# Altium schematic sheet 01_POWER.SchDoc
size A3; SheetNumber: 1; SheetTotal: 7
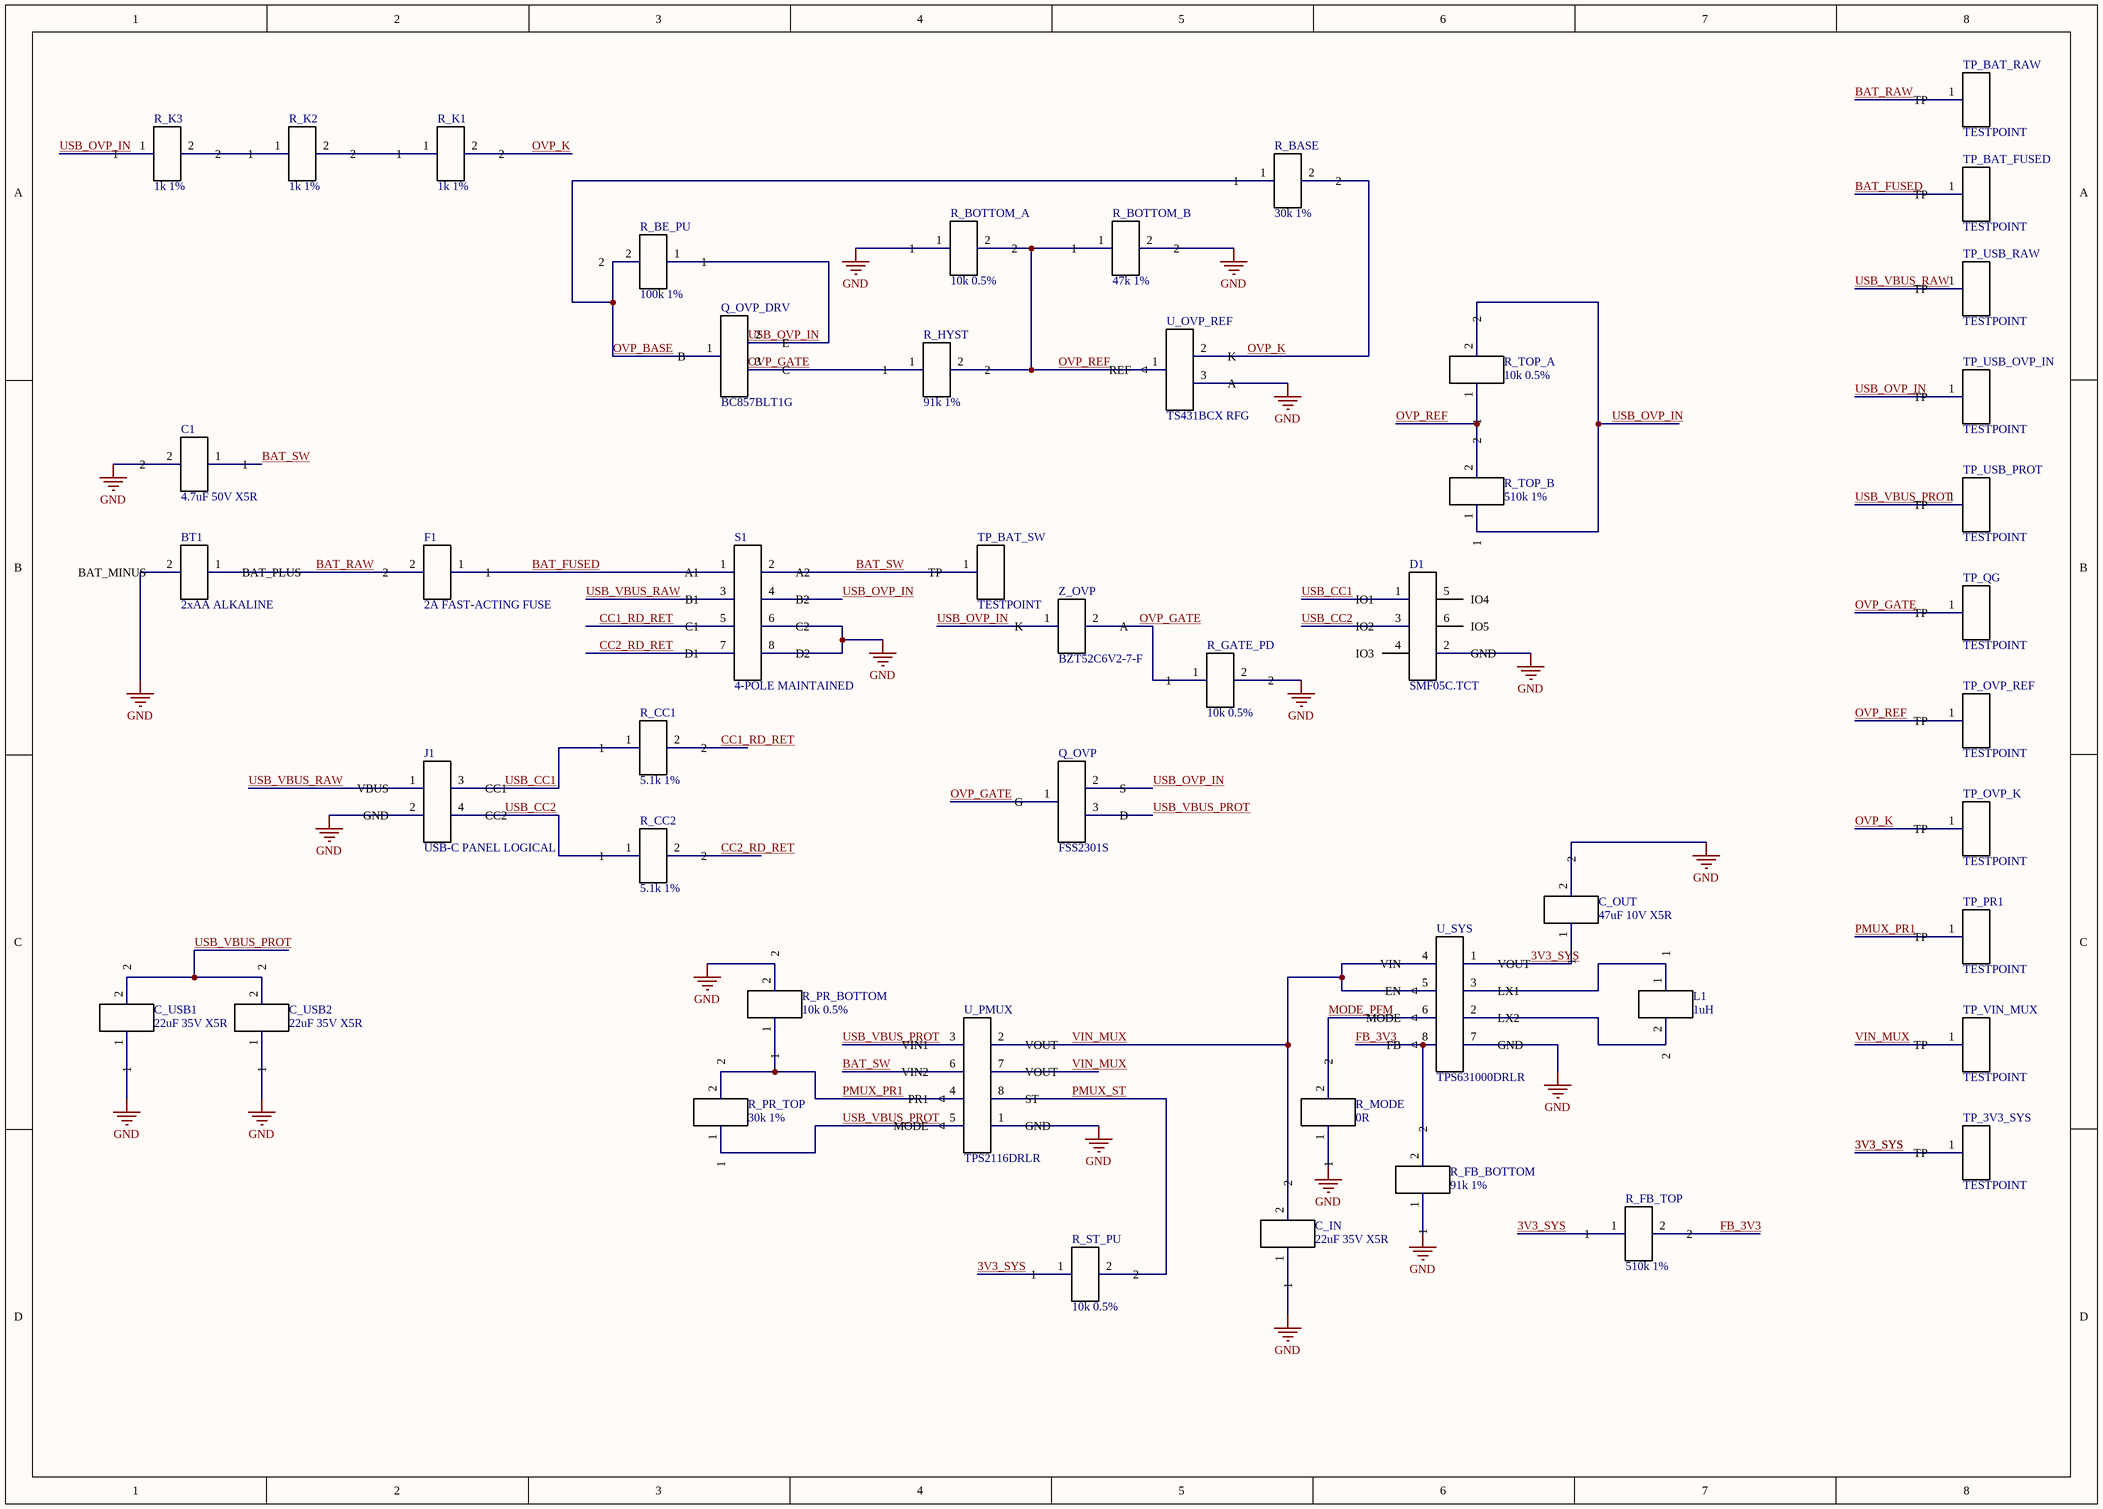
[diagram p0: 01_POWER.SchDoc]

## Parts
BT1  2xAA ALKALINE  [JST_XH_B2B_XH_A_2P_THT]
C1  4.7uF 50V X5R  [TDK_C2012_0805_CAP_2P]
C_IN  22uF 35V X5R  [TDK_C2012_0805_CAP_2P]
C_OUT  47uF 10V X5R  [TDK_C2012_0805_CAP_2P]
C_USB1  22uF 35V X5R  [TDK_C2012_0805_CAP_2P]
C_USB2  22uF 35V X5R  [TDK_C2012_0805_CAP_2P]
D1  SMF05C.TCT  [SEMTECH_SC70_6L_SMF05C]
F1  2A FAST-ACTING FUSE  [JDT_JFC2410FS_2P]
J1  USB-C PANEL LOGICAL  [JST_XH_B4B_XH_A_4P_THT]
L1  1uH  [MURATA_DFE322512F_2P]
Q_OVP  FSS2301S  [FOSAN_SOT23_FSS2301S_3P]
Q_OVP_DRV  BC857BLT1G  [ONSEMI_CASE318_SOT23_3P]
R_BASE  30k 1%  [RES_0603_SHARED_2P]
R_BE_PU  100k 1%  [RES_0603_SHARED_2P]
R_BOTTOM_A  10k 0.5%  [RES_0805_SHARED_2P]
R_BOTTOM_B  47k 1%  [RES_0603_SHARED_2P]
R_CC1  5.1k 1%  [RES_0603_SHARED_2P]
R_CC2  5.1k 1%  [RES_0603_SHARED_2P]
R_FB_BOTTOM  91k 1%  [RES_0805_SHARED_2P]
R_FB_TOP  510k 1%  [UNIROYAL_RES_1206_2P]
R_GATE_PD  10k 0.5%  [RES_0805_SHARED_2P]
R_HYST  91k 1%  [RES_0805_SHARED_2P]
R_K1  1k 1%  [RES_0805_SHARED_2P]
R_K2  1k 1%  [RES_0805_SHARED_2P]
R_K3  1k 1%  [RES_0805_SHARED_2P]
R_MODE  0R  [RES_0603_SHARED_2P]
R_PR_BOTTOM  10k 0.5%  [RES_0805_SHARED_2P]
R_PR_TOP  30k 1%  [RES_0603_SHARED_2P]
R_ST_PU  10k 0.5%  [RES_0805_SHARED_2P]
R_TOP_A  10k 0.5%  [RES_0805_SHARED_2P]
R_TOP_B  510k 1%  [UNIROYAL_RES_1206_2P]
S1  4-POLE MAINTAINED  [JST_XH_B8B_XH_A_8P_THT]
TP_3V3_SYS  TESTPOINT  [TESTPOINT_GENERIC_1P5MM]
TP_BAT_FUSED  TESTPOINT  [TESTPOINT_GENERIC_1P5MM]
TP_BAT_RAW  TESTPOINT  [TESTPOINT_GENERIC_1P5MM]
TP_BAT_SW  TESTPOINT  [TESTPOINT_GENERIC_1P5MM]
TP_OVP_K  TESTPOINT  [TESTPOINT_GENERIC_1P5MM]
TP_OVP_REF  TESTPOINT  [TESTPOINT_GENERIC_1P5MM]
TP_PR1  TESTPOINT  [TESTPOINT_GENERIC_1P5MM]
TP_QG  TESTPOINT  [TESTPOINT_GENERIC_1P5MM]
TP_USB_OVP_IN  TESTPOINT  [TESTPOINT_GENERIC_1P5MM]
TP_USB_PROT  TESTPOINT  [TESTPOINT_GENERIC_1P5MM]
TP_USB_RAW  TESTPOINT  [TESTPOINT_GENERIC_1P5MM]
TP_VIN_MUX  TESTPOINT  [TESTPOINT_GENERIC_1P5MM]
U_OVP_REF  TS431BCX RFG  [TSC_SOT23_TS431_3P]
U_PMUX  TPS2116DRLR  [TI_DRL0008A_8P]
U_SYS  TPS631000DRLR  [TI_DRL0008A_8P]
Z_OVP  BZT52C6V2-7-F  [DIODES_SOD123_2P]

## Nets
GND: BT1.2(BAT_MINUS) C1.2 C_IN.1 C_OUT.2 C_USB1.1 C_USB2.1 D1.2(GND) J1.2(GND) R_BOTTOM_A.1 R_BOTTOM_B.2 R_FB_BOTTOM.1 R_GATE_PD.2 R_MODE.1 R_PR_BOTTOM.2 S1.6(C2) S1.8(D2) U_OVP_REF.3(A) U_PMUX.1(GND) U_SYS.7(GND)
3V3_SYS: C_OUT.1 R_FB_TOP.1 R_ST_PU.1 TP_3V3_SYS.1(TP) U_SYS.1(VOUT)
BAT_FUSED: F1.1 S1.1(A1) TP_BAT_FUSED.1(TP)
BAT_RAW: BT1.1(BAT_PLUS) F1.2 TP_BAT_RAW.1(TP)
BAT_SW: C1.1 S1.2(A2) TP_BAT_SW.1(TP) U_PMUX.6(VIN2)
CC1_RD_RET: R_CC1.2 S1.5(C1)
CC2_RD_RET: R_CC2.2 S1.7(D1)
FB_3V3: R_FB_BOTTOM.2 R_FB_TOP.2 U_SYS.8(FB)
MODE_PFM: R_MODE.2 U_SYS.6(MODE)
OVP_BASE: Q_OVP_DRV.1(B) R_BASE.1 R_BE_PU.2
OVP_GATE: Q_OVP.1(G) Q_OVP_DRV.3(C) R_GATE_PD.1 R_HYST.1 TP_QG.1(TP) Z_OVP.2(A)
OVP_K: R_BASE.2 R_K1.2 TP_OVP_K.1(TP) U_OVP_REF.2(K)
OVP_REF: R_BOTTOM_A.2 R_BOTTOM_B.1 R_HYST.2 R_TOP_A.1 R_TOP_B.2 TP_OVP_REF.1(TP) U_OVP_REF.1(REF)
PMUX_PR1: R_PR_BOTTOM.1 R_PR_TOP.2 TP_PR1.1(TP) U_PMUX.4(PR1)
PMUX_ST: R_ST_PU.2 U_PMUX.8(ST)
USB_CC1: D1.1(IO1) J1.3(CC1) R_CC1.1
USB_CC2: D1.3(IO2) J1.4(CC2) R_CC2.1
USB_OVP_IN: Q_OVP.2(S) Q_OVP_DRV.2(E) R_BE_PU.1 R_K3.1 R_TOP_A.2 R_TOP_B.1 S1.4(B2) TP_USB_OVP_IN.1(TP) Z_OVP.1(K)
USB_VBUS_PROT: C_USB1.2 C_USB2.2 Q_OVP.3(D) R_PR_TOP.1 TP_USB_PROT.1(TP) U_PMUX.3(VIN1) U_PMUX.5(MODE)
USB_VBUS_RAW: J1.1(VBUS) S1.3(B1) TP_USB_RAW.1(TP)
VIN_MUX: C_IN.2 TP_VIN_MUX.1(TP) U_PMUX.2(VOUT) U_PMUX.7(VOUT) U_SYS.4(VIN) U_SYS.5(EN)
NetL1_1: L1.1 U_SYS.3(LX1)
NetL1_2: L1.2 U_SYS.2(LX2)
NetR_K1_1: R_K1.1 R_K2.2
NetR_K2_1: R_K2.1 R_K3.2

Not connected (* = marked no-connect by the designer): D1 4(IO3) 5(IO4) 6(IO5)

## Library data of the parts
BT1 = BATTERY_2XAA_OFFBOARD: Off-board two-cell AA battery holder logical interface; Manufacturer: PROJECT_LOGICAL; Source_Baseline: POWER_SCHEMATIC_ENTRY_BASELINE_v0.17_FA.txt; Qualification_Status: UNQUALIFIED_PENDING_SAVE_REOPEN_AUDIT; PIN_NUMBER_SOURCE: PROJECT_LOGICAL_DEFINITION; MPN: BATTERY_2XAA_OFFBOARD; Value: 2xAA ALKALINE; Package: LOGICAL_OFFBOARD; Datasheet: POWER_SCHEMATIC_ENTRY_BASELINE_v0.17_FA.txt; Design_Status: PROJECT_LOGICAL; PIN_FUNCTION_SOURCE: PROJECT_LOGICAL_DEFINITION
C1 = C2012X5R1H475K125AB: Battery-side local ceramic capacitor; Manufacturer: TDK; Source_Baseline: POWER_SCHEMATIC_ENTRY_BASELINE_v0.17_FA.txt; Design_Status: CONTROLLED_V0.17_P9; Qualification_Status: UNQUALIFIED_PENDING_SAVE_REOPEN_AUDIT; PIN_NUMBER_SOURCE: INTERNAL_CONVENTION; PIN_FUNCTION_SOURCE: MANUFACTURER_DATASHEET; MPN: C2012X5R1H475K125AB; Value: 4.7uF 50V X5R; Package: 0805 / 2012 metric; Datasheet: TDK exact product data C2012X5R1H475K125AB
C_IN C_USB1 C_USB2 = C2012X5R1V226M125AC: Power-path ceramic capacitor; Manufacturer: TDK; Source_Baseline: POWER_SCHEMATIC_ENTRY_BASELINE_v0.17_FA.txt; Design_Status: CONTROLLED_V0.17_P9; Qualification_Status: UNQUALIFIED_PENDING_SAVE_REOPEN_AUDIT; PIN_NUMBER_SOURCE: INTERNAL_CONVENTION; PIN_FUNCTION_SOURCE: MANUFACTURER_DATASHEET; MPN: C2012X5R1V226M125AC; Value: 22uF 35V X5R; Package: 0805 / 2012 metric; Datasheet: TDK exact product data C2012X5R1V226M125AC
C_OUT = C2012X5R1A476M125AC: 3V3 output ceramic capacitor; Manufacturer: TDK; Source_Baseline: POWER_SCHEMATIC_ENTRY_BASELINE_v0.17_FA.txt; Design_Status: CONTROLLED_V0.17_P9; Qualification_Status: UNQUALIFIED_PENDING_SAVE_REOPEN_AUDIT; PIN_NUMBER_SOURCE: INTERNAL_CONVENTION; PIN_FUNCTION_SOURCE: MANUFACTURER_DATASHEET; MPN: C2012X5R1A476M125AC; Value: 47uF 10V X5R; Package: 0805 / 2012 metric; Datasheet: TDK exact product data C2012X5R1A476M125AC
D1 = SMF05C.TCT: Five-line ESD protection array; Manufacturer: Semtech; Source_Baseline: POWER_SCHEMATIC_ENTRY_BASELINE_v0.17_FA.txt; Design_Status: CONTROLLED_V0.17; Qualification_Status: UNQUALIFIED_PENDING_SAVE_REOPEN_AUDIT; PIN_NUMBER_SOURCE: MANUFACTURER_DATASHEET; MPN: SMF05C.TCT; Value: SMF05C.TCT; Package: SC70-6; Datasheet: https://www.semtech.com/products/circuit-protection/esd-protection/smf05c; PIN_FUNCTION_SOURCE: MANUFACTURER_DATASHEET
F1 = JFC2410-1200FS: Battery input fast-acting fuse; Manufacturer: JDT Fuse; Source_Baseline: POWER_SCHEMATIC_ENTRY_BASELINE_v0.17_FA.txt; Design_Status: PROCUREMENT_LOCK_P9_PENDING; Qualification_Status: UNQUALIFIED_PENDING_SAVE_REOPEN_AUDIT; PIN_NUMBER_SOURCE: INTERNAL_CONVENTION; PIN_FUNCTION_SOURCE: MANUFACTURER_DATASHEET; MPN: JFC2410-1200FS; Value: 2A FAST-ACTING FUSE; Package: 2410 SMD; Datasheet: https://www.jdtfuse.com/upload/PDF/JFC2410FS.pdf
J1 = USB_C_PANEL_LOGICAL: Off-board USB-C panel connector logical interface; Manufacturer: PROJECT_LOGICAL; Source_Baseline: POWER_SCHEMATIC_ENTRY_BASELINE_v0.17_FA.txt; Qualification_Status: UNQUALIFIED_PENDING_SAVE_REOPEN_AUDIT; PIN_NUMBER_SOURCE: PROJECT_LOGICAL_DEFINITION; MPN: USB_C_PANEL_LOGICAL; Value: USB-C PANEL LOGICAL; Package: LOGICAL_OFFBOARD; Datasheet: POWER_SCHEMATIC_ENTRY_BASELINE_v0.17_FA.txt; Design_Status: PROJECT_LOGICAL; PIN_FUNCTION_SOURCE: PROJECT_LOGICAL_DEFINITION
L1 = DFE322512F-1R0M=P2: Shielded power inductor; Manufacturer: Murata; Source_Baseline: POWER_SCHEMATIC_ENTRY_BASELINE_v0.17_FA.txt; Design_Status: DESIGN_LOCK_V0.17_P9_PENDING; Qualification_Status: UNQUALIFIED_PENDING_SAVE_REOPEN_AUDIT; PIN_NUMBER_SOURCE: INTERNAL_CONVENTION; PIN_FUNCTION_SOURCE: MANUFACTURER_DATASHEET; MPN: DFE322512F-1R0M=P2; Value: 1uH; Package: DFE3225; Datasheet: Murata DFE322512F product data
Q_OVP = FSS2301S: -20V P-channel enhancement MOSFET used as USB OVP switch; Manufacturer: FOSAN; Source_Baseline: POWER_SCHEMATIC_ENTRY_BASELINE_v0.17_FA.txt; Design_Status: CONTROLLED_V0.17_P9; Qualification_Status: UNQUALIFIED_PENDING_SAVE_REOPEN_AUDIT; PIN_NUMBER_SOURCE: INTERNAL_CONVENTION; PIN_FUNCTION_SOURCE: MANUFACTURER_DATASHEET; MPN: FSS2301S; Value: FSS2301S; Package: SOT-23; Datasheet: FSS2301S_FOSAN_Official.pdf
Q_OVP_DRV = BC857BLT1G: PNP transistor used as OVP gate driver; Manufacturer: onsemi; Source_Baseline: POWER_SCHEMATIC_ENTRY_BASELINE_v0.17_FA.txt; Design_Status: CONTROLLED_V0.17_P9; Qualification_Status: UNQUALIFIED_PENDING_SAVE_REOPEN_AUDIT; PIN_NUMBER_SOURCE: MANUFACTURER_DATASHEET; MPN: BC857BLT1G; Value: BC857BLT1G; Package: SOT-23 / TO-236; Datasheet: onsemi BC856/BC857/BC858 manufacturer datasheet; PIN_FUNCTION_SOURCE: MANUFACTURER_DATASHEET
R_BASE R_PR_TOP = 0603WAF3002T5E: Power network resistor; Manufacturer: UNI-ROYAL; Source_Baseline: POWER_SCHEMATIC_ENTRY_BASELINE_v0.17_FA.txt; Design_Status: DESIGN_LOCK_V0.17; Qualification_Status: UNQUALIFIED_PENDING_SAVE_REOPEN_AUDIT; PIN_NUMBER_SOURCE: INTERNAL_CONVENTION; PIN_FUNCTION_SOURCE: MANUFACTURER_DATASHEET; MPN: 0603WAF3002T5E; Value: 30k 1%; Package: 0603; Datasheet: UNI-ROYAL manufacturer resistor data
R_BE_PU = 0603WAF1003T5E: OVP resistor; Manufacturer: UNI-ROYAL; Source_Baseline: POWER_SCHEMATIC_ENTRY_BASELINE_v0.17_FA.txt; Design_Status: CONTROLLED_V0.17_P9; Qualification_Status: UNQUALIFIED_PENDING_SAVE_REOPEN_AUDIT; PIN_NUMBER_SOURCE: INTERNAL_CONVENTION; PIN_FUNCTION_SOURCE: MANUFACTURER_DATASHEET; MPN: 0603WAF1003T5E; Value: 100k 1%; Package: 0603; Datasheet: UNI-ROYAL manufacturer resistor data
R_BOTTOM_A R_GATE_PD R_PR_BOTTOM R_ST_PU R_TOP_A = ARG05DTC1002: Precision power network resistor; Manufacturer: Viking Tech; Source_Baseline: POWER_SCHEMATIC_ENTRY_BASELINE_v0.17_FA.txt; Design_Status: DESIGN_LOCK_V0.17; Qualification_Status: UNQUALIFIED_PENDING_SAVE_REOPEN_AUDIT; PIN_NUMBER_SOURCE: INTERNAL_CONVENTION; PIN_FUNCTION_SOURCE: MANUFACTURER_DATASHEET; MPN: ARG05DTC1002; Value: 10k 0.5%; Package: 0805 / ARG05; Datasheet: Viking Tech AR series product data
R_BOTTOM_B = 0603WAF4702T5E: OVP resistor; Manufacturer: UNI-ROYAL; Source_Baseline: POWER_SCHEMATIC_ENTRY_BASELINE_v0.17_FA.txt; Design_Status: CONTROLLED_V0.17_P9; Qualification_Status: UNQUALIFIED_PENDING_SAVE_REOPEN_AUDIT; PIN_NUMBER_SOURCE: INTERNAL_CONVENTION; PIN_FUNCTION_SOURCE: MANUFACTURER_DATASHEET; MPN: 0603WAF4702T5E; Value: 47k 1%; Package: 0603; Datasheet: UNI-ROYAL manufacturer resistor data
R_CC1 R_CC2 = FRC0603F5101TS: USB-C Rd resistor; Manufacturer: FOJAN / FOSAN Technology; Source_Baseline: POWER_SCHEMATIC_ENTRY_BASELINE_v0.17_FA.txt; Design_Status: DESIGN_LOCK_V0.17; Qualification_Status: UNQUALIFIED_PENDING_SAVE_REOPEN_AUDIT; PIN_NUMBER_SOURCE: INTERNAL_CONVENTION; PIN_FUNCTION_SOURCE: MANUFACTURER_DATASHEET; MPN: FRC0603F5101TS; Value: 5.1k 1%; Package: 0603; Datasheet: FRC0603F5101TS-UniOhm.pdf / FOSAN FRC Series FJ-JS-3001-V3.0
R_FB_BOTTOM R_HYST = 0805W8F9102T5E: Power feedback/hysteresis resistor; Manufacturer: UNI-ROYAL; Source_Baseline: POWER_SCHEMATIC_ENTRY_BASELINE_v0.17_FA.txt; Design_Status: DESIGN_LOCK_V0.17; Qualification_Status: UNQUALIFIED_PENDING_SAVE_REOPEN_AUDIT; PIN_NUMBER_SOURCE: INTERNAL_CONVENTION; PIN_FUNCTION_SOURCE: MANUFACTURER_DATASHEET; MPN: 0805W8F9102T5E; Value: 91k 1%; Package: 0805; Datasheet: UNI-ROYAL manufacturer resistor data
R_FB_TOP R_TOP_B = 1206W4F5103T5E: Power feedback resistor; Manufacturer: UNI-ROYAL; Source_Baseline: POWER_SCHEMATIC_ENTRY_BASELINE_v0.17_FA.txt; Design_Status: DESIGN_LOCK_V0.17; Qualification_Status: UNQUALIFIED_PENDING_SAVE_REOPEN_AUDIT; PIN_NUMBER_SOURCE: INTERNAL_CONVENTION; PIN_FUNCTION_SOURCE: MANUFACTURER_DATASHEET; MPN: 1206W4F5103T5E; Value: 510k 1%; Package: 1206; Datasheet: UNI-ROYAL manufacturer resistor data
R_K1-R_K3 = 0805W8F1001T5E: OVP series resistor; Manufacturer: UNI-ROYAL; Source_Baseline: POWER_SCHEMATIC_ENTRY_BASELINE_v0.17_FA.txt; Design_Status: CONTROLLED_V0.17_P9; Qualification_Status: UNQUALIFIED_PENDING_SAVE_REOPEN_AUDIT; PIN_NUMBER_SOURCE: INTERNAL_CONVENTION; PIN_FUNCTION_SOURCE: MANUFACTURER_DATASHEET; MPN: 0805W8F1001T5E; Value: 1k 1%; Package: 0805; Datasheet: UNI-ROYAL manufacturer resistor data
R_MODE = SER0603J0R: Zero-ohm mode strap; Manufacturer: VICO / Anhui Xiangsheng Technology; Source_Baseline: POWER_SCHEMATIC_ENTRY_BASELINE_v0.17_FA.txt; Design_Status: DESIGN_LOCK_V0.17; Qualification_Status: UNQUALIFIED_PENDING_SAVE_REOPEN_AUDIT; PIN_NUMBER_SOURCE: INTERNAL_CONVENTION; PIN_FUNCTION_SOURCE: MANUFACTURER_DATASHEET; MPN: SER0603J0R; Value: 0R; Package: 0603; Datasheet: SER0603J0R-VO-Sub-Brand-(ER).pdf
S1 = S1_4POLE_MAINTAINED_OFFBOARD: Four independent maintained off-board switch contacts; Manufacturer: PROJECT_LOGICAL; Source_Baseline: POWER_SCHEMATIC_ENTRY_BASELINE_v0.17_FA.txt; Design_Status: PROJECT_LOGICAL_MECH_HOLD; Qualification_Status: UNQUALIFIED_PENDING_SAVE_REOPEN_AUDIT; PIN_NUMBER_SOURCE: PROJECT_LOGICAL_DEFINITION; MPN: S1_4POLE_MAINTAINED_OFFBOARD; Value: 4-POLE MAINTAINED; Package: LOGICAL_OFFBOARD; Datasheet: POWER_SCHEMATIC_ENTRY_BASELINE_v0.17_FA.txt; PIN_FUNCTION_SOURCE: PROJECT_LOGICAL_DEFINITION
TP_3V3_SYS TP_BAT_FUSED TP_BAT_RAW TP_BAT_SW TP_OVP_K TP_OVP_REF TP_PR1 TP_QG TP_USB_OVP_IN TP_USB_PROT TP_USB_RAW TP_VIN_MUX = TESTPOINT_GENERIC: Generic schematic test point; Manufacturer: PROJECT_LOGICAL; Source_Baseline: POWER_SCHEMATIC_ENTRY_BASELINE_v0.17_FA.txt; Qualification_Status: UNQUALIFIED_PENDING_SAVE_REOPEN_AUDIT; PIN_NUMBER_SOURCE: PROJECT_LOGICAL_DEFINITION; MPN: TESTPOINT_GENERIC; Value: TESTPOINT; Package: LOGICAL; Datasheet: POWER_SCHEMATIC_ENTRY_BASELINE_v0.17_FA.txt; Design_Status: PROJECT_LOGICAL; PIN_FUNCTION_SOURCE: PROJECT_LOGICAL_DEFINITION
U_OVP_REF = TS431BCX RFG: Programmable shunt reference, B grade; Manufacturer: Taiwan Semiconductor; Source_Baseline: POWER_SCHEMATIC_ENTRY_BASELINE_v0.17_FA.txt; Design_Status: CONTROLLED_V0.17_P9; Qualification_Status: UNQUALIFIED_PENDING_SAVE_REOPEN_AUDIT; PIN_NUMBER_SOURCE: MANUFACTURER_DATASHEET; MPN: TS431BCX RFG; Value: TS431BCX RFG; Package: SOT-23; Datasheet: https://services.taiwansemi.com/storage/resources/datasheet/TS431_K2412.pdf; PIN_FUNCTION_SOURCE: MANUFACTURER_DATASHEET
U_PMUX = TPS2116DRLR: Power multiplexer with priority control; Manufacturer: Texas Instruments; Source_Baseline: POWER_SCHEMATIC_ENTRY_BASELINE_v0.17_FA.txt; Design_Status: CONTROLLED_V0.17_P9; Qualification_Status: UNQUALIFIED_PENDING_SAVE_REOPEN_AUDIT; PIN_NUMBER_SOURCE: MANUFACTURER_DATASHEET; MPN: TPS2116DRLR; Value: TPS2116DRLR; Package: DRL / SOT-5X3-8; Datasheet: https://www.ti.com/lit/ds/symlink/tps2116.pdf; PIN_FUNCTION_SOURCE: MANUFACTURER_DATASHEET
U_SYS = TPS631000DRLR: 3.3V system buck-boost converter; Manufacturer: Texas Instruments; Source_Baseline: POWER_SCHEMATIC_ENTRY_BASELINE_v0.17_FA.txt; Design_Status: DESIGN_LOCK_V0.17_P9_PENDING; Qualification_Status: UNQUALIFIED_PENDING_SAVE_REOPEN_AUDIT; PIN_NUMBER_SOURCE: MANUFACTURER_DATASHEET; MPN: TPS631000DRLR; Value: TPS631000DRLR; Package: DRL / SOT-5X3-8; Datasheet: https://www.ti.com/lit/ds/symlink/tps631000.pdf; PIN_FUNCTION_SOURCE: MANUFACTURER_DATASHEET
Z_OVP = BZT52C6V2-7-F: 6.2V zener gate-source clamp; Manufacturer: Diodes Incorporated; Source_Baseline: POWER_SCHEMATIC_ENTRY_BASELINE_v0.17_FA.txt; Design_Status: CONTROLLED_V0.17_P9; Qualification_Status: UNQUALIFIED_PENDING_SAVE_REOPEN_AUDIT; PIN_NUMBER_SOURCE: INTERNAL_CONVENTION; PIN_FUNCTION_SOURCE: MANUFACTURER_DATASHEET; MPN: BZT52C6V2-7-F; Value: BZT52C6V2-7-F; Package: SOD-123; Datasheet: https://www.diodes.com/datasheet/download/BZT52Cxx.pdf